# EAGLE design mem2 (EAGLE 4.13)
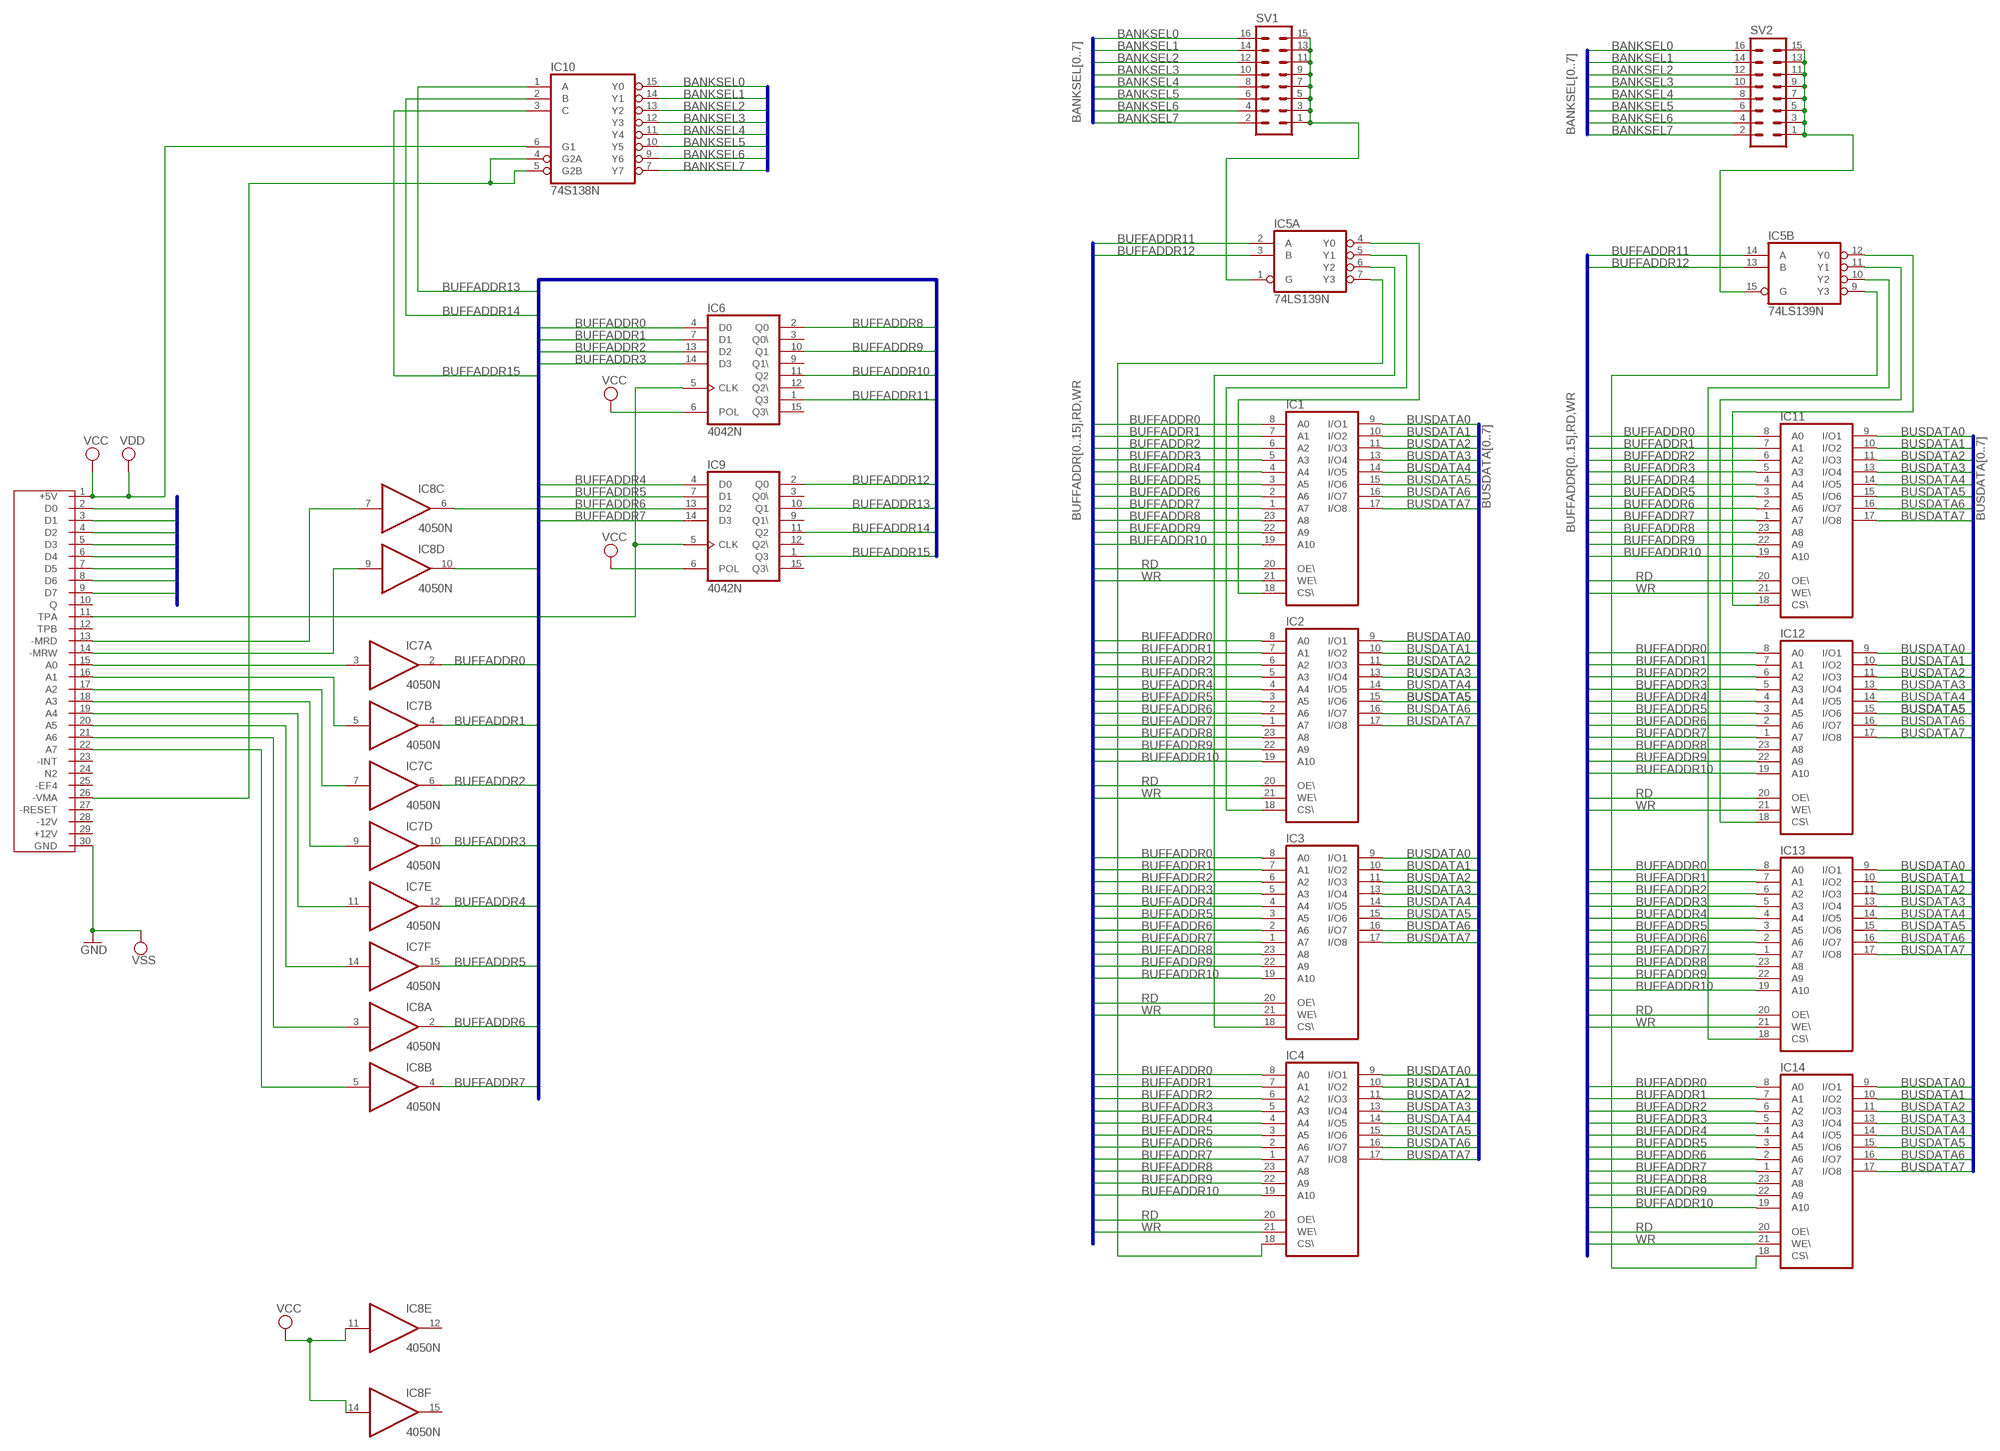
[diagram p0: schematic, sheet 1]

## Parts
IC1  6116P  [DIL24-6]
IC2  6116P  [DIL24-6]
IC3  6116P  [DIL24-6]
IC4  6116P  [DIL24-6]
IC5  74LS139N  [DIL16]
IC6  4042N  [DIL16]
IC7  4050N  [DIL16]
IC8  4050N  [DIL16]
IC9  4042N  [DIL16]
IC10  74S138N  [DIL16]
IC11  6116P  [DIL24-6]
IC12  6116P  [DIL24-6]
IC13  6116P  [DIL24-6]
IC14  6116P  [DIL24-6]
SV1  MA08-2  [MA08-2]
SV2  MA08-2  [MA08-2]
U$1  C30  [C30]

## Nets
BANKSEL0: IC10.15(Y0) SV1.16 SV2.16
BANKSEL1: IC10.14(Y1) SV1.14 SV2.14
BANKSEL2: IC10.13(Y2) SV1.12 SV2.12
BANKSEL3: IC10.12(Y3) SV1.10 SV2.10
BANKSEL4: IC10.11(Y4) SV1.8 SV2.8
BANKSEL5: IC10.10(Y5) SV1.6 SV2.6
BANKSEL6: IC10.9(Y6) SV1.4 SV2.4
BANKSEL7: IC10.7(Y7) SV1.2 SV2.2
BUFFADDR0: IC1.8(A0) IC2.8(A0) IC3.8(A0) IC4.8(A0) IC6.4(D0) IC7.2(A:O) IC11.8(A0) IC12.8(A0) IC13.8(A0) IC14.8(A0)
BUFFADDR1: IC1.7(A1) IC2.7(A1) IC3.7(A1) IC4.7(A1) IC6.7(D1) IC7.4(B:O) IC11.7(A1) IC12.7(A1) IC13.7(A1) IC14.7(A1)
BUFFADDR2: IC1.6(A2) IC2.6(A2) IC3.6(A2) IC4.6(A2) IC6.13(D2) IC7.6(C:O) IC11.6(A2) IC12.6(A2) IC13.6(A2) IC14.6(A2)
BUFFADDR3: IC1.5(A3) IC2.5(A3) IC3.5(A3) IC4.5(A3) IC6.14(D3) IC7.10(D:O) IC11.5(A3) IC12.5(A3) IC13.5(A3) IC14.5(A3)
BUFFADDR4: IC1.4(A4) IC2.4(A4) IC3.4(A4) IC4.4(A4) IC7.12(E:O) IC9.4(D0) IC11.4(A4) IC12.4(A4) IC13.4(A4) IC14.4(A4)
BUFFADDR5: IC1.3(A5) IC2.3(A5) IC3.3(A5) IC4.3(A5) IC7.15(F:O) IC9.7(D1) IC11.3(A5) IC12.3(A5) IC13.3(A5) IC14.3(A5)
BUFFADDR6: IC1.2(A6) IC2.2(A6) IC3.2(A6) IC4.2(A6) IC8.2(A:O) IC9.13(D2) IC11.2(A6) IC12.2(A6) IC13.2(A6) IC14.2(A6)
BUFFADDR7: IC1.1(A7) IC2.1(A7) IC3.1(A7) IC4.1(A7) IC8.4(B:O) IC9.14(D3) IC11.1(A7) IC12.1(A7) IC13.1(A7) IC14.1(A7)
BUFFADDR8: IC1.23(A8) IC2.23(A8) IC3.23(A8) IC4.23(A8) IC6.2(Q0) IC11.23(A8) IC12.23(A8) IC13.23(A8) IC14.23(A8)
BUFFADDR9: IC1.22(A9) IC2.22(A9) IC3.22(A9) IC4.22(A9) IC6.10(Q1) IC11.22(A9) IC12.22(A9) IC13.22(A9) IC14.22(A9)
BUFFADDR10: IC1.19(A10) IC2.19(A10) IC3.19(A10) IC4.19(A10) IC6.11(Q2) IC11.19(A10) IC12.19(A10) IC13.19(A10) IC14.19(A10)
BUFFADDR11: IC5.2(A:A) IC5.14(B:A) IC6.1(Q3)
BUFFADDR12: IC5.3(A:B) IC5.13(B:B) IC9.2(Q0)
BUFFADDR13: IC9.10(Q1) IC10.1(A)
BUFFADDR14: IC9.11(Q2) IC10.2(B)
BUFFADDR15: IC9.1(Q3) IC10.3(C)
BUSDATA0: IC1.9(I/O1) IC2.9(I/O1) IC3.9(I/O1) IC4.9(I/O1) IC11.9(I/O1) IC12.9(I/O1) IC13.9(I/O1) IC14.9(I/O1) U$1.2(D0)
BUSDATA1: IC1.10(I/O2) IC2.10(I/O2) IC3.10(I/O2) IC4.10(I/O2) IC11.10(I/O2) IC12.10(I/O2) IC13.10(I/O2) IC14.10(I/O2) U$1.3(D1)
BUSDATA2: IC1.11(I/O3) IC2.11(I/O3) IC3.11(I/O3) IC4.11(I/O3) IC11.11(I/O3) IC12.11(I/O3) IC13.11(I/O3) IC14.11(I/O3) U$1.4(D2)
BUSDATA3: IC1.13(I/O4) IC2.13(I/O4) IC3.13(I/O4) IC4.13(I/O4) IC11.13(I/O4) IC12.13(I/O4) IC13.13(I/O4) IC14.13(I/O4) U$1.5(D3)
BUSDATA4: IC1.14(I/O5) IC2.14(I/O5) IC3.14(I/O5) IC4.14(I/O5) IC11.14(I/O5) IC12.14(I/O5) IC13.14(I/O5) IC14.14(I/O5) U$1.6(D4)
BUSDATA5: IC1.15(I/O6) IC2.15(I/O6) IC3.15(I/O6) IC4.15(I/O6) IC11.15(I/O6) IC12.15(I/O6) IC13.15(I/O6) IC14.15(I/O6) U$1.7(D5)
BUSDATA6: IC1.16(I/O7) IC2.16(I/O7) IC3.16(I/O7) IC4.16(I/O7) IC11.16(I/O7) IC12.16(I/O7) IC13.16(I/O7) IC14.16(I/O7) U$1.8(D6)
BUSDATA7: IC1.17(I/O8) IC2.17(I/O8) IC3.17(I/O8) IC4.17(I/O8) IC11.17(I/O8) IC12.17(I/O8) IC13.17(I/O8) IC14.17(I/O8) U$1.9(D7)
GND: U$1.30(GND) ; supply symbol labelled VSS
N$1: IC1.18(CS\) IC5.4(A:Y0)
N$2: IC2.18(CS\) IC5.5(A:Y1)
N$3: IC3.18(CS\) IC5.6(A:Y2)
N$4: IC4.18(CS\) IC5.7(A:Y3)
N$5: IC6.5(CLK) IC9.5(CLK) U$1.11(TPA)
N$6: IC5.1(A:G) SV1.1 SV1.3 SV1.5 SV1.7 SV1.9 SV1.11 SV1.13 SV1.15
N$7: IC7.3(A:I) U$1.15(A0)
N$8: IC7.5(B:I) U$1.16(A1)
N$9: IC7.7(C:I) U$1.17(A2)
N$10: IC7.9(D:I) U$1.18(A3)
N$11: IC7.11(E:I) U$1.19(A4)
N$12: IC7.14(F:I) U$1.20(A5)
N$13: IC8.3(A:I) U$1.21(A6)
N$14: IC8.5(B:I) U$1.22(A7)
N$15: IC5.12(B:Y0) IC11.18(CS\)
N$16: IC5.11(B:Y1) IC12.18(CS\)
N$17: IC5.10(B:Y2) IC13.18(CS\)
N$18: IC5.9(B:Y3) IC14.18(CS\)
N$19: IC5.15(B:G) SV2.1 SV2.3 SV2.5 SV2.7 SV2.9 SV2.11 SV2.13 SV2.15
N$25: IC8.9(D:I) U$1.14(-MRW)
N$26: IC8.7(C:I) U$1.13(-MRD)
N$27: IC10.4(G2A) IC10.5(G2B) U$1.26(-VMA)
RD: IC1.20(OE\) IC2.20(OE\) IC3.20(OE\) IC4.20(OE\) IC8.6(C:O) IC11.20(OE\) IC12.20(OE\) IC13.20(OE\) IC14.20(OE\)
VCC: IC6.6(POL) IC8.11(E:I) IC8.14(F:I) IC9.6(POL) IC10.6(G1) U$1.1(+5V) ; supply symbol labelled VDD
WR: IC1.21(WE\) IC2.21(WE\) IC3.21(WE\) IC4.21(WE\) IC8.10(D:O) IC11.21(WE\) IC12.21(WE\) IC13.21(WE\) IC14.21(WE\)
Unconnected: IC6.3(Q0\) IC6.9(Q1\) IC6.12(Q2\) IC6.15(Q3\) IC8.12(E:O) IC8.15(F:O) IC9.3(Q0\) IC9.9(Q1\) IC9.12(Q2\) IC9.15(Q3\) U$1.10(Q) U$1.12(TPB) U$1.23(-INT) U$1.24(N2) U$1.25(-EF4) U$1.27(-RESET)

## Buses
BUFFADDR[0..15],RD,WR
BUSDATA[0..7]
BANKSEL[0..7]

## Power pins joined to a net without a drawn wire
+12V: U$1.29(+12V)
-12V: U$1.28(-12V)
GND: IC1.12(GND) IC2.12(GND) IC3.12(GND) IC4.12(GND) IC5.8(P:GND) IC10.8(GND) IC11.12(GND) IC12.12(GND) IC13.12(GND) IC14.12(GND)
VCC: IC1.24(VCC) IC2.24(VCC) IC3.24(VCC) IC4.24(VCC) IC5.16(P:VCC) IC10.16(VCC) IC11.24(VCC) IC12.24(VCC) IC13.24(VCC) IC14.24(VCC)
VDD: IC6.16(VDD) IC7.1(P:VDD) IC8.1(P:VDD) IC9.16(VDD)
VSS: IC6.8(VSS) IC7.8(P:VSS) IC8.8(P:VSS) IC9.8(VSS)

## Library data of the parts
IC1-IC4 IC11-IC14 = memory-idt:6116P: MEMORY
IC5 = 74xx-us:74*139: Dual 2-line to 4-line DECODER/DEMULTIPLEXER
IC6 IC9 = 40xx:4042: Quad clocked D LATCH
IC7 IC8 = 40xx:4050: Hex non-inverting BUFFER
IC10 = 74xx-us:74*138: 3-line to 8-line DECODER/DEMULTIPLEXER
SV1 SV2 = con-lstb:MA08-2: PIN HEADER
U$1 = k1:C30

## Board
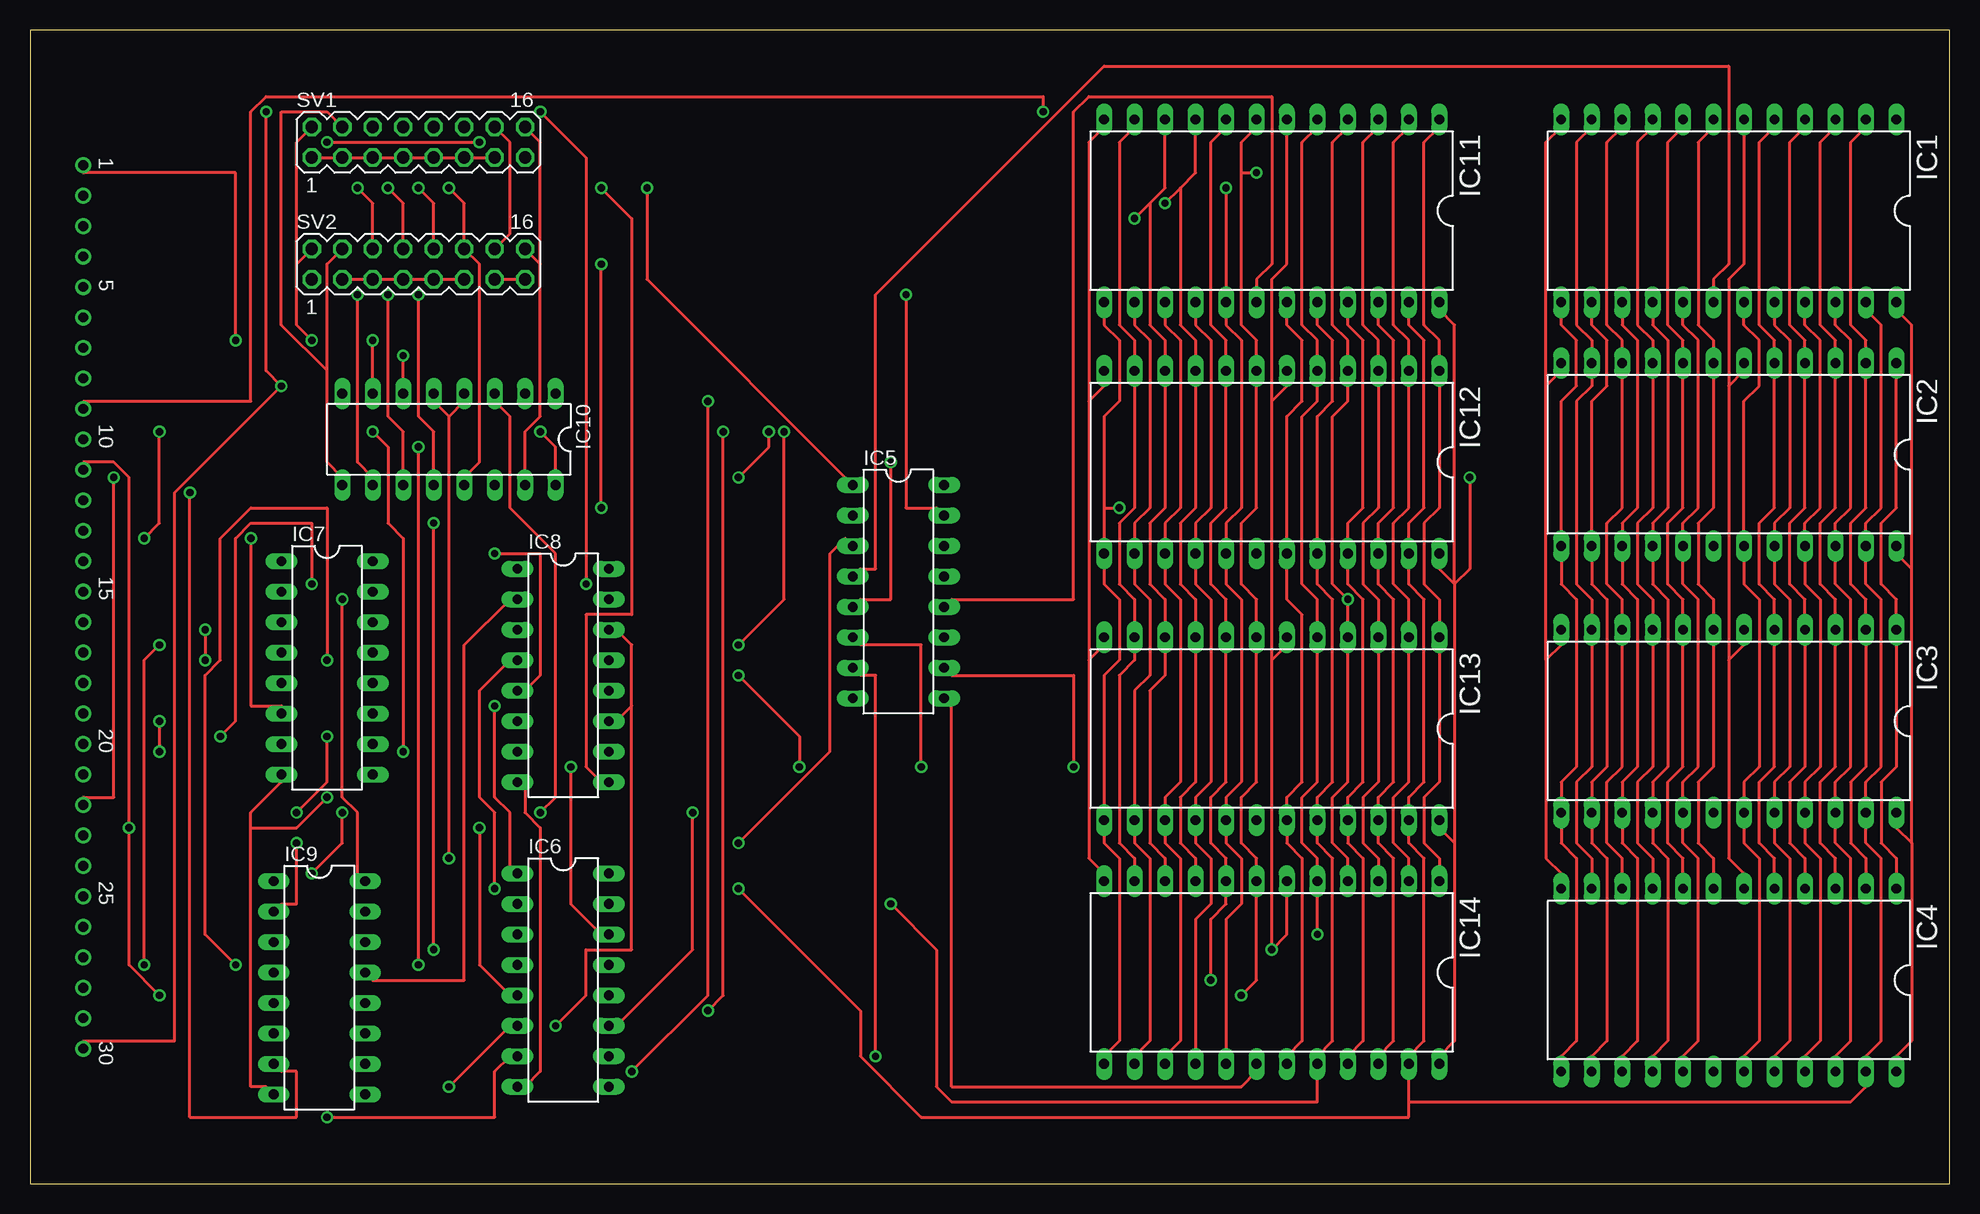
[diagram p1: board, top side]
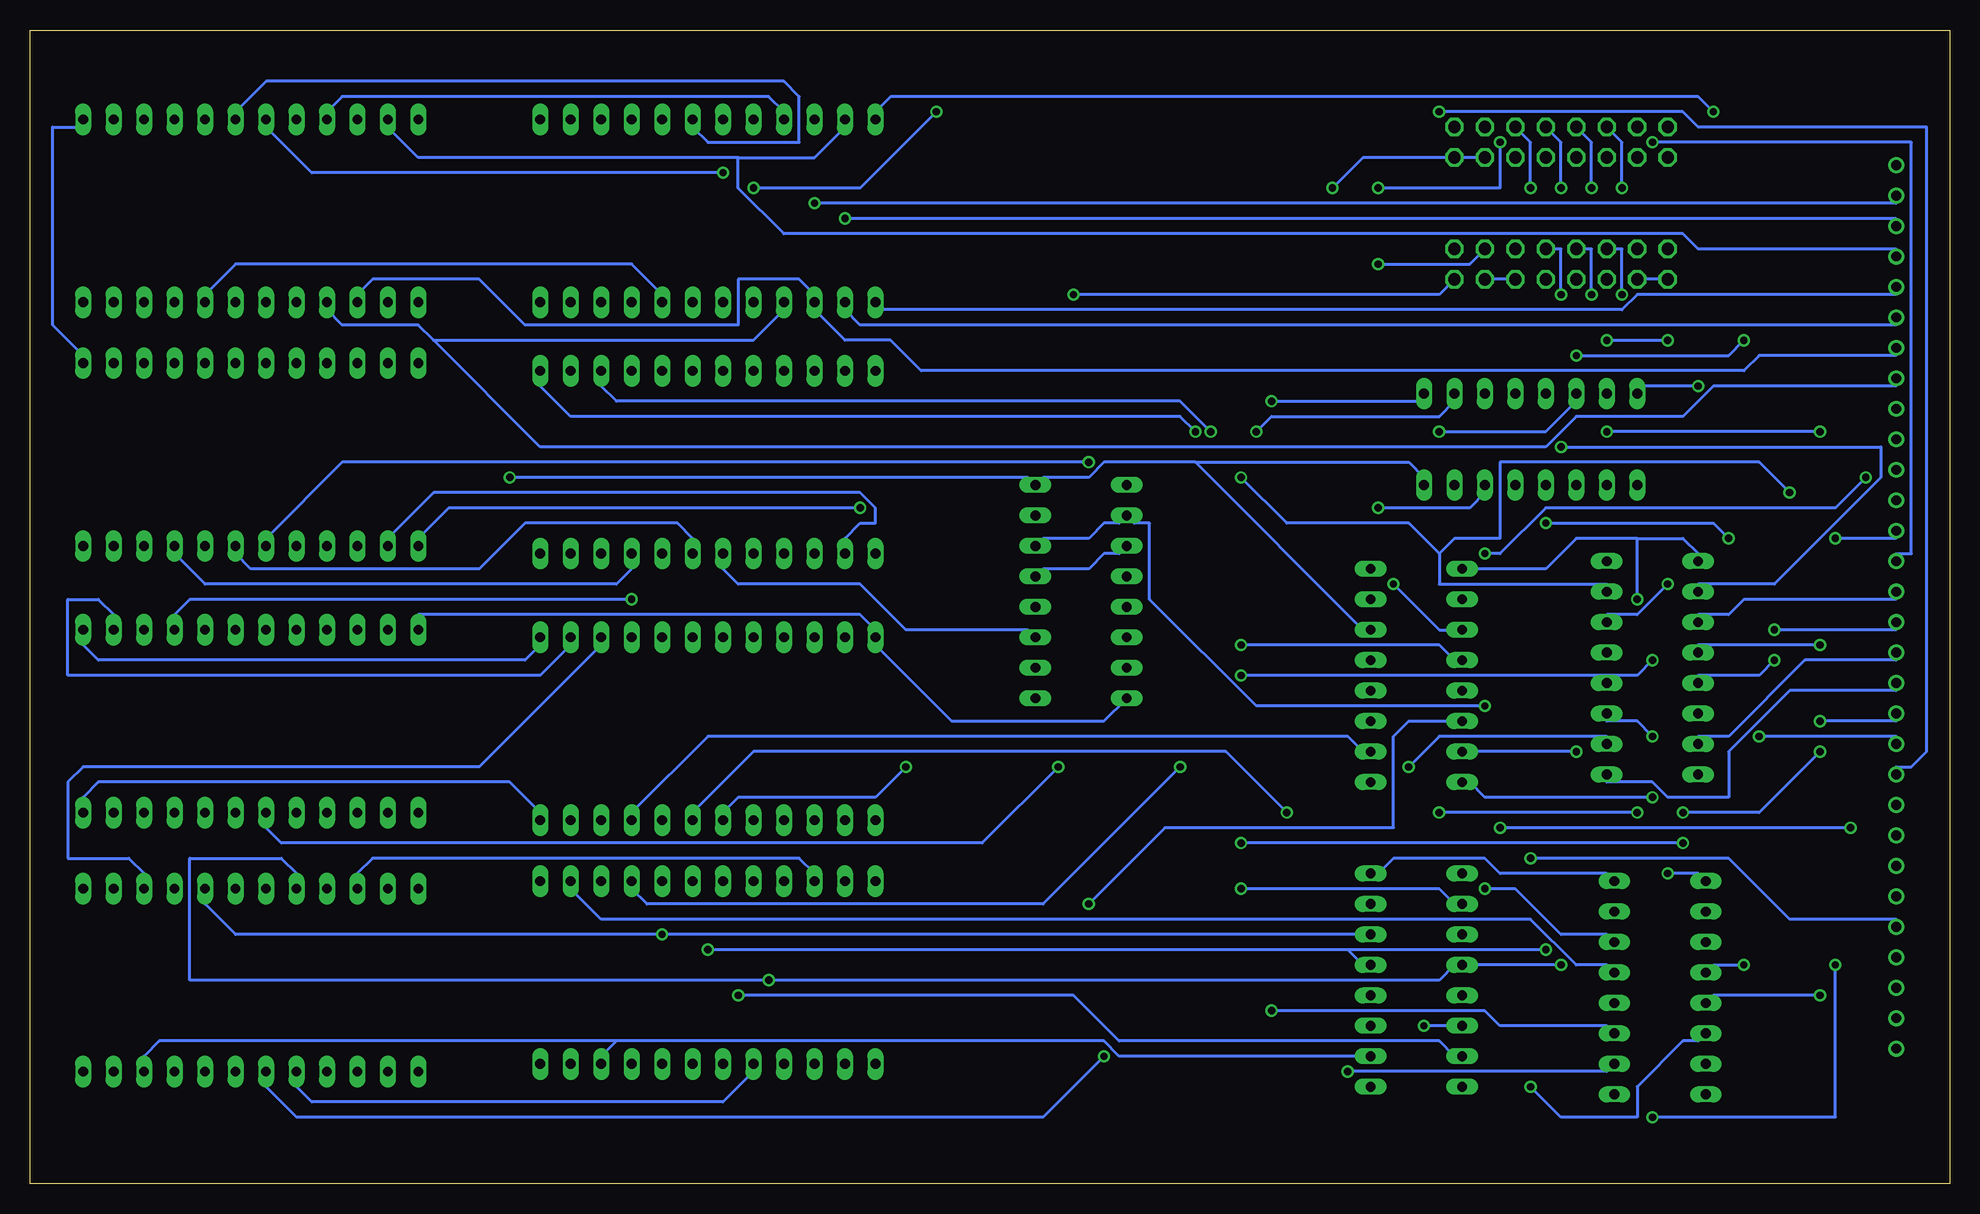
[diagram p2: board, bottom side, seen from below]

Size 160 x 96.19 mm. Coordinates in mm from the lower left corner, seen from the top.
Outline: 0,0 160,0 160,96.19 0,96.19 0,0
Copper layers (1*16): Top 0.035mm / dielectric 1.5mm / Bottom 0.035mm
Design rules "default": minimum track width 10mil, minimum drill 24mil, track to track 8mil, track to pad 8mil, pad to pad 8mil, via to via 8mil, smd to smd 8mil, copper to edge 40mil, drill to drill 8mil, minimum pad ring 10mil, minimum via ring 8mil, stop-mask expansion 4mil, vias tented up to drill 0mil, thermal gap 10mil
tRestrict: area 0,91.9 to 70.5,96.4; area 0,-0.2 to 70.5,4.3
bRestrict: area 0,91.9 to 70.5,96.4; area 0,91.9 to 70.5,96.4; area 0,0.5 to 70.5,4.3

### Footprints (pad centres in the part's own frame; a part is rotated, then mirrored left to right if it is on the bottom)
DIL24-6 = drill 0.813 long: 1 -13.97,-7.62; 2 -11.43,-7.62; 3 -8.89,-7.62; 4 -6.35,-7.62; 5 -3.81,-7.62; 6 -1.27,-7.62; 7 1.27,-7.62; 8 3.81,-7.62; 9 6.35,-7.62; 10 8.89,-7.62; 11 11.43,-7.62; 12 13.97,-7.62; 13 13.97,7.62; 14 11.43,7.62; 15 8.89,7.62; 16 6.35,7.62; 17 3.81,7.62; 18 1.27,7.62; 19 -1.27,7.62; 20 -3.81,7.62; 21 -6.35,7.62; 22 -8.89,7.62; 23 -11.43,7.62; 24 -13.97,7.62
DIL16 = drill 0.813 long: 1 -8.89,-3.81; 2 -6.35,-3.81; 3 -3.81,-3.81; 4 -1.27,-3.81; 5 1.27,-3.81; 6 3.81,-3.81; 7 6.35,-3.81; 8 8.89,-3.81; 9 8.89,3.81; 10 6.35,3.81; 11 3.81,3.81; 12 1.27,3.81; 13 -1.27,3.81; 14 -3.81,3.81; 15 -6.35,3.81; 16 -8.89,3.81
MA08-2 = drill 1.016 octagon: 1 -8.89,-1.27; 2 -8.89,1.27; 3 -6.35,-1.27; 4 -6.35,1.27; 5 -3.81,-1.27; 6 -3.81,1.27; 7 -1.27,-1.27; 8 -1.27,1.27; 9 1.27,-1.27; 10 1.27,1.27; 11 3.81,-1.27; 12 3.81,1.27; 13 6.35,-1.27; 14 6.35,1.27; 15 8.89,-1.27; 16 8.89,1.27
C30 = drill 0.813 round: 1 -36.83,0; 2 -34.29,0; 3 -31.75,0; 4 -29.21,0; 5 -26.67,0; 6 -24.13,0; 7 -21.59,0; 8 -19.05,0; 9 -16.51,0; 10 -13.97,0; 11 -11.43,0; 12 -8.89,0; 13 -6.35,0; 14 -3.81,0; 15 -1.27,0; 16 1.27,0; 17 3.81,0; 18 6.35,0; 19 8.89,0; 20 11.43,0; 21 13.97,0; 22 16.51,0; 23 19.05,0; 24 21.59,0; 25 24.13,0; 26 26.67,0; 27 29.21,0; 28 31.75,0; 29 34.29,0; 30 36.83,0

### Placement (x,y rotation side)
IC1  141.6,81.11 180 top
IC2  141.6,60.8 180 top
IC3  141.6,38.57 180 top
IC4  141.6,16.98 180 top
IC5  72.38,49.37 270 top
IC6  44.45,16.98 270 top
IC7  24.76,43.02 270 top
IC8  44.45,42.38 270 top
IC9  24.12,16.34 270 top
IC10  34.92,62.06 180 top
IC11  103.5,81.11 180 top
IC12  103.5,60.16 180 top
IC13  103.5,37.94 180 top
IC14  103.5,17.61 180 top
SV1  32.38,86.83 0 top
SV2  32.38,76.67 0 top
U$1  4.44,48.09 270 top

### Tracks (layer width: path | path; a pad name or v marks a point on that pad's centre or on a via)
BANKSEL0
  Top 0.254: 42.54,76.67 42.54,63.97 41.27,62.7 IC10.15 | 42.54,76.67 SV2.16 | SV1.16 42.54,86.83 42.54,76.67
BANKSEL1  (via drill 0.61)
  Top 0.254: v47.62,56.35 v47.62,76.67 | SV1.14 40,86.83 40,79.21 SV2.14
  Bottom 0.254: v47.62,56.35 40,56.35 38.73,57.62 IC10.14 | v47.62,76.67 40,76.67 SV2.14
BANKSEL2  (via drill 0.61)
  Top 0.254: IC10.13 36.19,58.89 37.46,60.16 37.46,76.67 SV2.12 36.19,81.75 v34.92,83.02
  Bottom 0.254: SV1.12 34.92,86.83 v34.92,83.02
BANKSEL3  (via drill 0.61)
  Top 0.254: v32.38,74.13 32.38,63.97 33.65,62.7 IC10.12 | v32.38,83.02 33.65,81.75 SV2.10
  Bottom 0.254: v32.38,74.13 32.38,77.94 SV2.10 | SV1.10 32.38,86.83 v32.38,83.02
BANKSEL4  (via drill 0.61)
  Top 0.254: v29.84,74.13 29.84,63.97 31.11,62.7 IC10.11 | v29.84,83.02 31.11,81.75 SV2.8
  Bottom 0.254: v29.84,74.13 29.84,77.94 SV2.8 | SV1.8 29.84,86.83 v29.84,83.02
BANKSEL5  (via drill 0.61)
  Top 0.254: v27.3,74.13 27.3,60.16 28.57,58.89 IC10.10 | v27.3,83.02 28.57,81.75 SV2.6
  Bottom 0.254: v27.3,74.13 27.3,77.94 SV2.6 | SV1.6 27.3,86.83 v27.3,83.02
BANKSEL6
  Top 0.254: 24.76,67.78 24.76,76.67 SV2.4 | 24.76,67.78 24.76,60.16 26.03,58.89 IC10.9 | SV1.4 24.76,89.37 20.95,89.37 20.95,71.59 24.76,67.78
BANKSEL7  (via drill 0.61)
  Top 0.254: v23.49,70.32 22.22,71.59 22.22,76.67 | 22.22,76.67 SV2.2 | IC10.7 v28.57,70.32 | SV1.2 22.22,86.83 22.22,76.67
  Bottom 0.254: v28.57,70.32 v23.49,70.32
BUFFADDR0  (via drill 0.61)
  Top 0.254: IC1.8 137.79,88.1 136.52,86.83 136.52,71.59 137.79,70.32 IC2.8 137.79,56.35 136.52,55.08 136.52,50 137.79,48.73 IC3.8 137.79,34.76 136.52,33.49 136.52,28.41 137.79,27.14 IC4.8 | IC11.8 99.69,88.1 98.42,86.83 98.42,71.59 99.69,70.32 IC12.8 99.69,56.35 98.42,55.08 98.42,50 99.69,48.73 IC13.8 99.69,33.49 98.42,32.22 98.42,28.41 99.69,27.14 IC14.8 99.69,23.33 98.42,22.06 v98.42,16.98 | v32.38,18.25 v32.38,61.43
  Bottom 0.254: v32.38,61.43 5.71,61.43 5.71,58.89 14.6,50 20.95,50 IC7.2 | v32.38,18.25 IC6.4 41.27,18.25 42.54,16.98 v98.42,16.98 146.68,16.98 146.68,27.14 139.06,27.14 137.79,25.87 IC4.8
BUFFADDR1  (via drill 0.61)
  Top 0.254: IC1.7 140.33,88.1 139.06,86.83 139.06,71.59 140.33,70.32 IC2.7 140.33,56.35 139.06,55.08 139.06,50 140.33,48.73 IC3.7 140.33,34.76 139.06,33.49 139.06,28.41 140.33,27.14 IC4.7 | 100.96,84.29 100.96,86.83 102.23,88.1 IC11.7 | 100.96,84.29 100.96,71.59 102.23,70.32 IC12.7 102.23,56.35 100.96,55.08 100.96,50 102.23,48.73 IC13.7 102.23,33.49 100.96,32.22 100.96,28.41 102.23,27.14 IC14.7 102.23,16.98 v100.96,15.71 | v10.79,44.92 9.52,43.65 v9.52,18.25 | v24.76,5.55 38.73,5.55 38.73,9.36 40,10.63 IC6.7 | 100.96,84.29 v102.23,84.29
  Bottom 0.254: v100.96,15.71 73.02,15.71 69.21,11.9 42.54,11.9 41.27,10.63 IC6.7 | v10.79,44.92 20.95,44.92 IC7.4 | v9.52,18.25 9.52,5.55 v24.76,5.55 | v102.23,84.29 136.52,84.29 140.33,88.1 IC1.7
BUFFADDR2  (via drill 0.61)
  Top 0.254: 141.6,43.65 141.6,27.14 142.87,25.87 IC4.6 | 141.6,43.65 142.87,44.92 IC3.6 | 141.6,66.51 142.87,67.78 IC2.6 | 141.6,66.51 141.6,43.65 | 141.6,66.51 141.6,75.4 142.87,76.67 IC1.6 | IC14.6 104.77,20.79 v103.5,19.52 103.5,43.65 | v18.41,53.81 18.41,39.84 20.95,39.84 IC7.6 | v33.65,19.52 v33.65,55.08 | 103.5,43.65 104.77,44.92 IC13.6 | 103.5,65.24 104.77,66.51 IC12.6 | 103.5,43.65 103.5,65.24 | 103.5,65.24 103.5,75.4 104.77,76.67 IC11.6
  Bottom 0.254: 50.16,19.52 48.89,18.25 IC6.13 | 50.16,19.52 v103.5,19.52 | v18.41,53.81 19.68,55.08 v33.65,55.08 | v33.65,19.52 50.16,19.52 | IC1.6 142.87,89.37 140.33,91.91 97.15,91.91 95.88,90.64 95.88,86.83 103.5,86.83 104.77,88.1 IC11.6
BUFFADDR3  (via drill 0.61)
  Top 0.254: IC11.5 107.31,88.1 106.04,86.83 106.04,71.59 107.31,70.32 IC12.5 107.31,65.24 106.04,63.97 106.04,50 107.31,48.73 IC13.5 107.31,33.49 106.04,32.22 106.04,28.41 107.31,27.14 IC14.5 v107.31,20.79 | v45.08,34.76 45.08,23.33 47.62,20.79 IC6.14 | IC1.5 145.41,88.1 144.14,86.83 144.14,71.59 145.41,70.32 IC2.5 145.41,56.35 144.14,55.08 144.14,50 145.41,48.73 IC3.5 145.41,34.76 144.14,33.49 144.14,28.41 145.41,27.14 IC4.5
  Bottom 0.254: v45.08,34.76 42.54,37.3 28.57,37.3 IC7.10 | IC6.14 v107.31,20.79 142.87,20.79 145.41,23.33 IC4.5
BUFFADDR4  (via drill 0.61)
  Top 0.254: IC1.4 147.95,88.1 146.68,86.83 146.68,71.59 147.95,70.32 IC2.4 147.95,56.35 146.68,55.08 146.68,50 147.95,48.73 IC3.4 147.95,34.76 146.68,33.49 146.68,28.41 147.95,27.14 IC4.4 | v17.14,18.25 14.6,20.79 14.6,42.38 15.87,43.65 15.87,53.81 18.41,56.35 24.76,56.35 v24.76,43.65 | IC14.4 109.85,27.14 108.58,28.41 108.58,32.22 109.85,33.49 IC13.4 v109.85,48.73 108.58,50 108.58,63.97 109.85,65.24 IC12.4 109.85,70.32 108.58,71.59 108.58,86.83 109.85,88.1 IC11.4 | v59.05,42.38 64.13,37.3 v64.13,34.76
  Bottom 0.254: v17.14,18.25 19.68,18.25 IC9.4 | v24.76,43.65 26.03,42.38 28.57,42.38 | 28.57,42.38 v59.05,42.38 | v64.13,34.76 75.56,23.33 108.58,23.33 109.85,24.6 IC14.4 | 28.57,42.38 IC7.12 | v109.85,48.73 146.68,48.73 147.95,47.46 IC3.4
BUFFADDR5  (via drill 0.61)
  Top 0.254: v13.33,57.62 13.33,5.55 22.22,5.55 22.22,9.36 20.95,9.36 IC9.7 | IC14.3 112.39,27.14 111.12,28.41 111.12,32.22 112.39,33.49 IC13.3 112.39,48.73 111.12,50 111.12,55.08 112.39,56.35 IC12.3 112.39,70.32 111.12,71.59 111.12,86.83 112.39,88.1 IC11.3 | IC1.3 150.49,88.1 149.22,86.83 149.22,71.59 150.49,70.32 IC2.3 150.49,56.35 149.22,55.08 149.22,50 150.49,48.73 IC3.3 150.49,34.76 149.22,33.49 149.22,28.41 150.49,27.14 IC4.3 | v59.05,58.89 61.59,61.43 v61.59,62.7
  Bottom 0.254: v13.33,57.62 15.87,60.16 37.46,60.16 37.46,53.81 41.27,53.81 42.54,52.54 | 42.54,52.54 42.54,50 28.57,50 IC7.15 | IC13.3 112.39,44.92 122.55,34.76 155.57,34.76 156.84,33.49 156.84,27.14 151.76,27.14 150.49,25.87 IC4.3 | 42.54,52.54 45.08,55.08 55.24,55.08 v59.05,58.89 | v61.59,62.7 64.13,65.24 111.12,65.24 112.39,66.51 IC12.3
BUFFADDR6
  Top 0.254: IC1.2 153.03,88.1 151.76,86.83 151.76,71.59 153.03,70.32 IC2.2 153.03,56.35 151.76,55.08 151.76,50 153.03,48.73 IC3.2 153.03,34.76 151.76,33.49 151.76,28.41 153.03,27.14 IC4.2 | IC9.13 28.57,16.98 36.19,16.98 36.19,44.92 40,48.73 IC8.2 | IC14.2 114.93,27.14 113.66,28.41 113.66,32.22 114.93,33.49 IC13.2 114.93,48.73 113.66,50 113.66,55.08 114.93,56.35 IC12.2 114.93,70.32 113.66,71.59 113.66,86.83 114.93,88.1 IC11.2
  Bottom 0.254: IC9.13 28.57,18.25 31.11,18.25 34.92,22.06 112.39,22.06 114.93,24.6 IC14.2 | IC3.2 153.03,47.46 154.3,48.73 156.84,48.73 156.84,42.38 117.47,42.38 114.93,44.92 IC13.2
BUFFADDR7  (via drill 0.61)
  Top 0.254: IC4.1 155.57,27.14 154.3,28.41 154.3,33.49 155.57,34.76 IC3.1 155.57,48.73 154.3,50 154.3,55.08 155.57,56.35 IC2.1 | v38.73,24.6 38.73,30.95 37.46,32.22 37.46,41.11 40,43.65 IC8.4 | IC14.1 117.47,27.14 116.2,28.41 116.2,32.22 117.47,33.49 IC13.1 117.47,48.73 116.2,50 116.2,55.08 117.47,56.35 IC12.1 117.47,70.32 116.2,71.59 116.2,86.83 117.47,88.1 IC11.1 | v59.05,44.92 62.86,48.73 v62.86,62.7
  Bottom 0.254: IC2.1 155.57,69.05 158.11,71.59 158.11,88.1 155.57,88.1 IC1.1 | v38.73,24.6 36.19,24.6 32.38,20.79 28.57,20.79 IC9.14 | v59.05,44.92 42.54,44.92 41.27,43.65 IC8.4 | v62.86,62.7 64.13,63.97 114.93,63.97 117.47,66.51 IC12.1 | IC3.1 155.57,44.92 154.3,43.65 118.74,43.65 117.47,44.92 IC13.1
BUFFADDR8  (via drill 0.61)
  Top 0.254: IC1.23 153.03,72.86 154.3,71.59 154.3,56.35 153.03,55.08 IC2.23 153.03,50 154.3,48.73 154.3,34.76 153.03,33.49 IC3.23 153.03,28.41 154.3,27.14 154.3,11.9 153.03,10.63 IC4.23 153.03,8.09 151.76,6.82 114.93,6.82 | IC11.23 114.93,71.59 116.2,70.32 116.2,56.35 114.93,55.08 IC12.23 114.93,50 116.2,48.73 116.2,33.49 114.93,32.22 IC13.23 114.93,28.41 116.2,27.14 116.2,11.9 114.93,10.63 IC14.23 114.93,6.82 | v59.05,24.6 69.21,14.44 69.21,10.63 74.29,5.55 114.93,5.55 114.93,6.82
  Bottom 0.254: v59.05,24.6 42.54,24.6 41.27,23.33 IC6.2
BUFFADDR9
  Top 0.254: IC1.22 150.49,71.59 151.76,70.32 151.76,56.35 150.49,55.08 IC2.22 150.49,50 151.76,48.73 151.76,34.76 150.49,33.49 IC3.22 150.49,28.41 151.76,27.14 151.76,11.9 150.49,10.63 IC4.22 | IC11.22 112.39,71.59 113.66,70.32 113.66,56.35 112.39,55.08 IC12.22 112.39,50 113.66,48.73 113.66,33.49 112.39,32.22 IC13.22 112.39,28.41 113.66,27.14 113.66,11.9 112.39,10.63 IC14.22
  Bottom 0.254: 111.12,11.9 70.48,11.9 69.21,10.63 IC6.10 | 111.12,11.9 112.39,10.63 IC14.22 | 111.12,11.9 149.22,11.9 150.49,10.63 IC4.22
BUFFADDR10  (via drill 0.61)
  Top 0.254: IC1.19 142.87,71.59 144.14,70.32 144.14,66.51 142.87,65.24 IC2.19 142.87,50 144.14,48.73 144.14,34.76 142.87,33.49 IC3.19 142.87,28.41 144.14,27.14 144.14,11.9 142.87,10.63 IC4.19 | IC11.19 104.77,71.59 106.04,70.32 106.04,65.24 104.77,63.97 IC12.19 104.77,48.73 106.04,47.46 106.04,33.49 104.77,32.22 IC13.19 104.77,28.41 106.04,27.14 106.04,11.9 104.77,10.63 IC14.19 | v55.24,30.95 55.24,19.52 48.89,13.17 IC6.11
  Bottom 0.254: v55.24,30.95 60.32,36.03 99.69,36.03 104.77,30.95 IC13.19 | IC2.19 142.87,52.54 141.6,51.27 122.55,51.27 118.74,55.08 106.04,55.08 104.77,53.81 IC12.19
BUFFADDR11  (via drill 0.61)
  Top 0.254: v38.73,39.84 38.73,32.22 40,30.95 40,25.87 IC6.1
  Bottom 0.254: v38.73,39.84 57.78,39.84 66.67,48.73 66.67,55.08 67.94,55.08 IC5.2 69.21,55.08 70.48,55.08 71.75,53.81 75.56,53.81 IC5.14
BUFFADDR12  (via drill 0.61)
  Top 0.254: v22.22,28.41 22.22,23.33 20.95,23.33 IC9.2 | v59.05,28.41 66.67,36.03 66.67,52.54 67.94,53.81 IC5.3
  Bottom 0.254: v22.22,28.41 v59.05,28.41 | IC5.13 75.56,51.27 71.75,51.27 70.48,52.54 69.21,52.54 IC5.3
BUFFADDR13  (via drill 0.61)
  Top 0.254: v50.16,9.36 56.51,15.71 v56.51,65.24
  Bottom 0.254: v50.16,9.36 28.57,9.36 IC9.10 | v56.51,65.24 43.81,65.24 IC10.1
BUFFADDR14  (via drill 0.61)
  Top 0.254: v56.51,14.44 57.78,15.71 v57.78,62.7
  Bottom 0.254: v56.51,14.44 38.73,14.44 37.46,13.17 28.57,13.17 IC9.11 | v57.78,62.7 56.51,63.97 42.54,63.97 41.27,65.24 IC10.2
BUFFADDR15  (via drill 0.61)
  Top 0.254: v23.49,25.87 26.03,28.41 v26.03,30.95 | v42.54,30.95 43.81,32.22 43.81,52.54 40,56.35 40,63.97 38.73,65.24 IC10.3
  Bottom 0.254: v23.49,25.87 20.95,25.87 IC9.1 | v26.03,30.95 v42.54,30.95
BUSDATA0  (via drill 0.61)
  Top 0.254: IC1.9 135.25,88.1 133.98,86.83 133.98,71.59 135.25,70.32 IC2.9 135.25,56.35 133.98,55.08 133.98,50 135.25,48.73 IC3.9 135.25,34.76 133.98,33.49 133.98,28.41 135.25,27.14 IC4.9 | IC14.9 97.15,27.14 95.88,28.41 95.88,32.22 97.15,33.49 IC13.9 97.15,48.73 95.88,50 95.88,55.08 97.15,56.35 IC12.9 97.15,70.32 95.88,71.59 95.88,83.02 | 95.88,83.02 97.15,84.29 IC11.9 | v94.61,81.75 95.88,83.02
  Bottom 0.254: v94.61,81.75 4.44,81.75 U$1.2 | IC1.9 135.25,89.37 133.98,90.64 98.42,90.64 97.15,89.37 IC11.9
BUSDATA1  (via drill 0.61)
  Top 0.254: IC1.10 132.71,88.1 131.44,86.83 131.44,71.59 132.71,70.32 IC2.10 132.71,56.35 131.44,55.08 131.44,50 132.71,48.73 IC3.10 132.71,34.76 131.44,33.49 131.44,28.41 132.71,27.14 IC4.10 | IC14.10 94.61,27.14 93.34,28.41 93.34,41.11 94.61,42.38 IC13.10 94.61,48.73 93.34,50 93.34,55.08 94.61,56.35 IC12.10 94.61,70.32 93.34,71.59 93.34,81.75 | 93.34,81.75 94.61,83.02 IC11.10 | v92.07,80.48 93.34,81.75
  Bottom 0.254: v92.07,80.48 4.44,80.48 U$1.3 | IC4.10 132.71,25.87 131.44,27.14 95.88,27.14 94.61,25.87 IC14.10
BUSDATA2
  Top 0.254: IC4.11 130.17,27.14 128.9,28.41 128.9,33.49 130.17,34.76 IC3.11 130.17,48.73 128.9,50 128.9,65.24 130.17,66.51 IC2.11 130.17,70.32 128.9,71.59 128.9,86.83 130.17,88.1 IC1.11 | IC14.11 92.07,27.14 90.8,28.41 90.8,42.38 92.07,43.65 IC13.11 92.07,48.73 90.8,50 90.8,55.08 92.07,56.35 IC12.11 92.07,70.32 90.8,71.59 90.8,86.83 92.07,88.1 IC11.11
  Bottom 0.254: 100.96,85.56 100.96,83.02 97.15,79.21 22.22,79.21 20.95,77.94 4.44,77.94 U$1.4 | 100.96,85.56 94.61,85.56 92.07,88.1 IC11.11 | 100.96,85.56 127.63,85.56 130.17,88.1 IC1.11
BUSDATA3  (via drill 0.61)
  Top 0.254: IC1.13 127.63,71.59 128.9,70.32 128.9,66.51 127.63,65.24 IC2.13 127.63,50 128.9,48.73 128.9,34.76 127.63,33.49 IC3.13 127.63,28.41 128.9,27.14 128.9,11.9 127.63,10.63 IC4.13 | IC14.13 89.53,10.63 90.8,11.9 90.8,27.14 89.53,28.41 IC13.13 89.53,42.38 90.8,43.65 90.8,48.73 89.53,50 IC12.13 89.53,56.35 | 89.53,56.35 89.53,63.97 90.8,65.24 90.8,70.32 89.53,71.59 IC11.13 | 89.53,56.35 v90.8,56.35
  Bottom 0.254: U$1.5 4.44,74.13 26.03,74.13 27.3,72.86 89.53,72.86 IC11.13 | v90.8,56.35 125.09,56.35 127.63,53.81 IC2.13
BUSDATA4
  Top 0.254: IC1.14 130.17,71.59 131.44,70.32 131.44,66.51 130.17,65.24 IC2.14 130.17,50 131.44,48.73 131.44,34.76 130.17,33.49 IC3.14 130.17,28.41 131.44,27.14 131.44,11.9 130.17,10.63 IC4.14 | IC14.14 92.07,10.63 93.34,11.9 93.34,27.14 92.07,28.41 IC13.14 92.07,41.11 93.34,42.38 93.34,48.73 92.07,50 IC12.14 92.07,55.08 93.34,56.35 93.34,70.32 92.07,71.59 IC11.14
  Bottom 0.254: U$1.6 4.44,71.59 90.8,71.59 92.07,72.86 IC11.14 | IC2.14 130.17,53.81 126.36,57.62 90.8,57.62 89.53,56.35 89.53,55.08 90.8,55.08 92.07,53.81 IC12.14
BUSDATA5
  Top 0.254: IC1.15 132.71,71.59 133.98,70.32 133.98,56.35 132.71,55.08 IC2.15 132.71,50 133.98,48.73 133.98,34.76 132.71,33.49 IC3.15 132.71,28.41 133.98,27.14 133.98,11.9 132.71,10.63 IC4.15 | IC14.15 94.61,10.63 95.88,11.9 95.88,27.14 94.61,28.41 IC13.15 94.61,32.22 95.88,33.49 95.88,48.73 94.61,50 IC12.15 94.61,55.08 95.88,56.35 95.88,70.32 94.61,71.59 IC11.15
  Bottom 0.254: U$1.7 4.44,69.05 15.87,69.05 17.14,67.78 85.72,67.78 88.26,70.32 92.07,70.32 94.61,72.86 IC11.15 94.61,74.13 95.88,75.4 100.96,75.4 100.96,71.59 118.74,71.59 122.55,75.4 131.44,75.4 132.71,74.13 IC1.15
BUSDATA6
  Top 0.254: IC14.16 97.15,22.06 98.42,23.33 98.42,27.14 97.15,28.41 IC13.16 97.15,32.22 98.42,33.49 98.42,48.73 97.15,50 IC12.16 97.15,55.08 98.42,56.35 98.42,70.32 97.15,71.59 IC11.16 | IC4.16 135.25,10.63 136.52,11.9 136.52,27.14 135.25,28.41 IC3.16 135.25,33.49 136.52,34.76 136.52,48.73 135.25,50 IC2.16 135.25,55.08 136.52,56.35 136.52,70.32 135.25,71.59 IC1.16
  Bottom 0.254: 126.36,70.32 127.63,71.59 133.98,71.59 135.25,72.86 IC1.16 | 126.36,70.32 117.47,61.43 33.65,61.43 31.11,63.97 22.22,63.97 19.68,66.51 4.44,66.51 U$1.8 | 126.36,70.32 99.69,70.32 97.15,72.86 IC11.16
BUSDATA7  (via drill 0.61)
  Top 0.254: IC1.17 137.79,71.59 139.06,70.32 139.06,56.35 137.79,55.08 IC2.17 137.79,50 139.06,48.73 139.06,34.76 137.79,33.49 IC3.17 137.79,28.41 139.06,27.14 139.06,11.9 137.79,10.63 IC4.17 | IC14.17 99.69,22.06 100.96,23.33 100.96,27.14 99.69,28.41 IC13.17 99.69,32.22 100.96,33.49 100.96,48.73 99.69,50 IC12.17 99.69,55.08 100.96,56.35 100.96,70.32 99.69,71.59 IC11.17 v99.69,83.02 | v84.45,89.37 84.45,90.64 19.68,90.64 18.41,89.37 18.41,65.24 4.44,65.24 U$1.9
  Bottom 0.254: v84.45,89.37 90.8,83.02 v99.69,83.02 | IC4.17 137.79,8.09 136.52,6.82 102.23,6.82 99.69,9.36 IC14.17
GND  (via drill 0.61)
  Top 0.254: U$1.30 4.44,11.9 12.06,11.9 12.06,57.62 v20.95,66.51 19.68,67.78 v19.68,89.37 | 126.36,43.65 126.36,27.14 127.63,25.87 IC4.12 | 126.36,43.65 127.63,44.92 IC3.12 | 126.36,66.51 127.63,67.78 IC2.12 | 126.36,43.65 126.36,66.51 | 126.36,66.51 126.36,86.83 127.63,88.1 IC1.12 | 88.26,43.65 88.26,27.14 89.53,25.87 IC14.12 | 88.26,43.65 89.53,44.92 IC13.12 | 88.26,65.24 89.53,66.51 IC12.12 | 88.26,65.24 88.26,43.65 | 88.26,65.24 88.26,86.83 89.53,88.1 IC11.12
  Bottom 0.254: v20.95,66.51 26.03,66.51 IC10.8 | IC5.8 70.48,38.57 83.18,38.57 89.53,44.92 IC13.12 89.53,46.19 90.8,47.46 127.63,47.46 IC3.12 | v19.68,89.37 20.95,90.64 88.26,90.64 89.53,89.37 IC11.12
N$1
  Top 0.254: IC5.4 69.21,51.27 70.48,51.27 70.48,74.13 89.53,93.18 141.6,93.18 141.6,76.67 140.33,75.4 IC1.18
N$2  (via drill 0.61)
  Top 0.254: v71.75,60.16 71.75,48.73 69.21,48.73 IC5.5
  Bottom 0.254: v71.75,60.16 133.98,60.16 140.33,53.81 IC2.18
N$3  (via drill 0.61)
  Top 0.254: v74.29,34.76 74.29,44.92 69.21,44.92 IC5.6
  Bottom 0.254: v74.29,34.76 80.64,28.41 139.06,28.41 140.33,29.68 IC3.18
N$4  (via drill 0.61)
  Top 0.254: v70.48,10.63 70.48,42.38 69.21,42.38 IC5.7
  Bottom 0.254: v70.48,10.63 75.56,5.55 137.79,5.55 140.33,8.09 IC4.18
N$5  (via drill 0.61)
  Top 0.254: v10.79,15.71 8.25,18.25 v8.25,29.68 8.25,58.89 6.98,60.16 4.44,60.16 U$1.11 | v37.46,29.68 37.46,18.25 40,15.71 IC6.5
  Bottom 0.254: v10.79,15.71 19.68,15.71 IC9.5 | v8.25,29.68 v37.46,29.68
N$6  (via drill 0.61)
  Top 0.254: SV1.1 SV1.3 SV1.5 SV1.7 SV1.9 SV1.11 SV1.13 | v51.43,83.02 51.43,75.4 IC5.1
  Bottom 0.254: v51.43,83.02 48.89,85.56 SV1.15 SV1.13
N$7
  Bottom 0.254: U$1.15 4.44,48.73 17.14,48.73 18.41,47.46 20.95,47.46 IC7.3
N$8  (via drill 0.61)
  Top 0.254: v14.6,46.19 v14.6,43.65
  Bottom 0.254: v14.6,46.19 4.44,46.19 U$1.16 | v14.6,43.65 15.87,42.38 20.95,42.38 IC7.5
N$9
  Bottom 0.254: U$1.17 4.44,43.65 12.06,43.65 18.41,37.3 20.95,37.3 IC7.7
N$10
  Bottom 0.254: U$1.18 4.44,41.11 13.33,41.11 18.41,36.03 18.41,32.22 23.49,32.22 24.76,33.49 28.57,33.49 IC7.9
N$11  (via drill 0.61)
  Top 0.254: v10.79,38.57 v10.79,36.03 | v22.22,30.95 24.76,33.49 v24.76,37.3
  Bottom 0.254: v10.79,38.57 4.44,38.57 U$1.19 | v10.79,36.03 15.87,30.95 v22.22,30.95 | v24.76,37.3 26.03,38.57 28.57,38.57 IC7.11
N$12  (via drill 0.61)
  Top 0.254: v15.87,37.3 17.14,38.57 17.14,53.81 18.41,55.08 23.49,55.08 v23.49,50
  Bottom 0.254: v15.87,37.3 4.44,37.3 U$1.20 | v23.49,50 26.03,47.46 28.57,47.46 IC7.14
N$13  (via drill 0.61)
  Top 0.254: v42.54,89.37 46.35,85.56 v46.35,50
  Bottom 0.254: v42.54,89.37 22.22,89.37 20.95,88.1 1.9,88.1 1.9,36.03 3.17,34.76 4.44,34.76 U$1.21 | v46.35,50 42.54,46.19 IC8.3
N$14  (via drill 0.61)
  Top 0.254: v6.98,58.89 6.98,32.22 4.44,32.22 U$1.22 | v38.73,52.54 42.54,52.54 42.54,42.38 41.27,41.11 IC8.5
  Bottom 0.254: v6.98,58.89 9.52,56.35 33.65,56.35 37.46,52.54 v38.73,52.54
N$15
  Top 0.254: IC5.12 76.83,48.73 86.99,48.73 86.99,89.37 88.26,90.64 103.5,90.64 103.5,76.67 102.23,75.4 IC11.18
N$16
  Bottom 0.254: IC5.11 76.83,46.19 86.99,46.19 90.8,50 100.96,50 102.23,51.27 IC12.18
N$17  (via drill 0.61)
  Top 0.254: v86.99,34.76 86.99,42.38 76.83,42.38 IC5.10
  Bottom 0.254: v86.99,34.76 89.53,32.22 100.96,32.22 102.23,30.95 IC13.18
N$18
  Top 0.254: IC14.18 102.23,9.36 100.96,8.09 76.83,8.09 76.83,39.84 IC5.9
N$19  (via drill 0.61)
  Top 0.254: SV2.3 SV2.5 SV2.7 SV2.9 SV2.11 | v73.02,74.13 73.02,56.35 75.56,56.35 IC5.15 | SV2.13 SV2.15
  Bottom 0.254: SV2.1 SV2.3 | v73.02,74.13 42.54,74.13 SV2.15 | SV2.11 SV2.13
N$25  (via drill 0.61)
  Top 0.254: v24.76,86.83 v37.46,86.83 | v47.62,83.02 50.16,80.48 50.16,47.46 46.35,47.46 46.35,34.76 47.62,33.49 IC8.9
  Bottom 0.254: v24.76,86.83 3.17,86.83 3.17,52.54 4.44,52.54 U$1.14 | v37.46,86.83 37.46,83.02 v47.62,83.02
N$26  (via drill 0.61)
  Top 0.254: v9.52,53.81 10.79,55.08 v10.79,62.7 | v28.57,62.7 29.84,61.43 29.84,55.08 31.11,53.81 v31.11,36.03
  Bottom 0.254: v9.52,53.81 4.44,53.81 U$1.13 | v10.79,62.7 v28.57,62.7 | v31.11,36.03 IC8.7
N$27  (via drill 0.61)
  Top 0.254: v34.92,27.14 34.92,63.97 | 34.92,63.97 33.65,65.24 IC10.5 | 34.92,63.97 36.19,65.24 IC10.4
  Bottom 0.254: v34.92,27.14 18.41,27.14 13.33,22.06 4.44,22.06 U$1.26
RD  (via drill 0.61)
  Top 0.254: IC1.20 145.41,71.59 146.68,70.32 146.68,56.35 145.41,55.08 IC2.20 145.41,50 146.68,48.73 146.68,34.76 145.41,33.49 IC3.20 145.41,28.41 146.68,27.14 146.68,11.9 145.41,10.63 IC4.20 | IC11.20 107.31,71.59 108.58,70.32 108.58,65.24 107.31,63.97 IC12.20 107.31,50 108.58,48.73 108.58,33.49 107.31,32.22 IC13.20 107.31,28.41 108.58,27.14 108.58,11.9 107.31,10.63 IC14.20 107.31,6.82 76.83,6.82 75.56,8.09 75.56,19.52 v71.75,23.33
  Bottom 0.254: v71.75,23.33 65.4,29.68 46.35,29.68 46.35,37.3 45.08,38.57 IC8.6 | IC1.20 145.41,74.13 142.87,76.67 109.85,76.67 107.31,74.13 IC11.20
VCC  (via drill 0.61)
  Top 0.254: 118.74,28.41 118.74,11.9 117.47,10.63 IC14.24 | 118.74,28.41 117.47,29.68 IC13.24 | 118.74,50 117.47,51.27 IC12.24 | 118.74,50 118.74,28.41 | 118.74,50 118.74,71.59 117.47,72.86 IC11.24 | 156.84,28.41 156.84,11.9 155.57,10.63 IC4.24 | 156.84,28.41 155.57,29.68 IC3.24 | 156.84,51.27 155.57,52.54 IC2.24 | 156.84,28.41 156.84,51.27 | 156.84,51.27 156.84,71.59 155.57,72.86 IC1.24 | v34.92,8.09 40,13.17 IC6.6 | 50.16,39.84 48.89,38.57 IC8.11 | 50.16,39.84 50.16,44.92 48.89,46.19 IC8.14 | v42.54,62.7 43.81,61.43 IC10.16 | v17.14,70.32 17.14,84.29 4.44,84.29 U$1.1 | IC10.6 v31.11,69.05 | v43.81,13.17 46.35,15.71 46.35,19.52 50.16,19.52 50.16,39.84 | 118.74,50 120.01,51.27 v120.01,58.89
  Bottom 0.254: IC13.24 117.47,30.95 120.01,33.49 154.3,33.49 155.57,32.22 IC3.24 | v34.92,8.09 32.38,5.55 26.03,5.55 26.03,8.09 22.22,11.9 20.95,11.9 IC9.6 | 62.86,60.16 70.48,60.16 71.75,58.89 75.56,58.89 IC5.16 76.83,58.89 v120.01,58.89 | 62.86,60.16 45.08,60.16 43.81,58.89 IC10.16 | v42.54,62.7 33.65,62.7 31.11,65.24 IC10.6 | v17.14,70.32 18.41,69.05 v31.11,69.05 | 62.86,60.16 48.89,46.19 IC8.14 | IC6.6 v43.81,13.17
VDD  (via drill 0.61)
  Top 0.254: v26.03,48.73 26.03,32.22 27.3,30.95 27.3,25.87 IC9.16
  Bottom 0.254: 26.03,53.81 22.22,53.81 20.95,52.54 IC7.1 | 26.03,53.81 31.11,53.81 33.65,51.27 IC8.1 | IC9.16 28.57,25.87 37.46,25.87 38.73,27.14 46.35,27.14 47.62,25.87 IC6.16 | v26.03,48.73 26.03,53.81
VSS  (via drill 0.61)
  Top 0.254: IC6.8 41.27,8.09 42.54,9.36 42.54,29.68 41.27,30.95 41.27,33.49 IC8.8 | 18.41,29.68 18.41,30.95 20.95,33.49 IC7.8 | 18.41,29.68 18.41,8.09 19.68,8.09 IC9.8 | v24.76,32.22 22.22,29.68 18.41,29.68
  Bottom 0.254: v24.76,32.22 38.73,32.22 40,33.49 IC8.8
WR
  Top 0.254: IC1.21 147.95,71.59 149.22,70.32 149.22,56.35 147.95,55.08 IC2.21 147.95,50 149.22,48.73 149.22,34.76 147.95,33.49 IC3.21 147.95,28.41 149.22,27.14 149.22,11.9 147.95,10.63 IC4.21 | IC11.21 109.85,71.59 111.12,70.32 111.12,56.35 109.85,55.08 IC12.21 109.85,50 111.12,48.73 111.12,33.49 109.85,32.22 IC13.21 109.85,28.41 111.12,27.14 111.12,11.9 109.85,10.63 IC14.21
  Bottom 0.254: IC8.10 48.89,36.03 50.16,37.3 103.5,37.3 109.85,30.95 IC13.21 | IC2.21 147.95,52.54 145.41,50 111.12,50 109.85,51.27 IC12.21